# Altium schematic sheet stm32f405.SchDoc
size A4; SheetNumber: 3; SheetTotal: 5
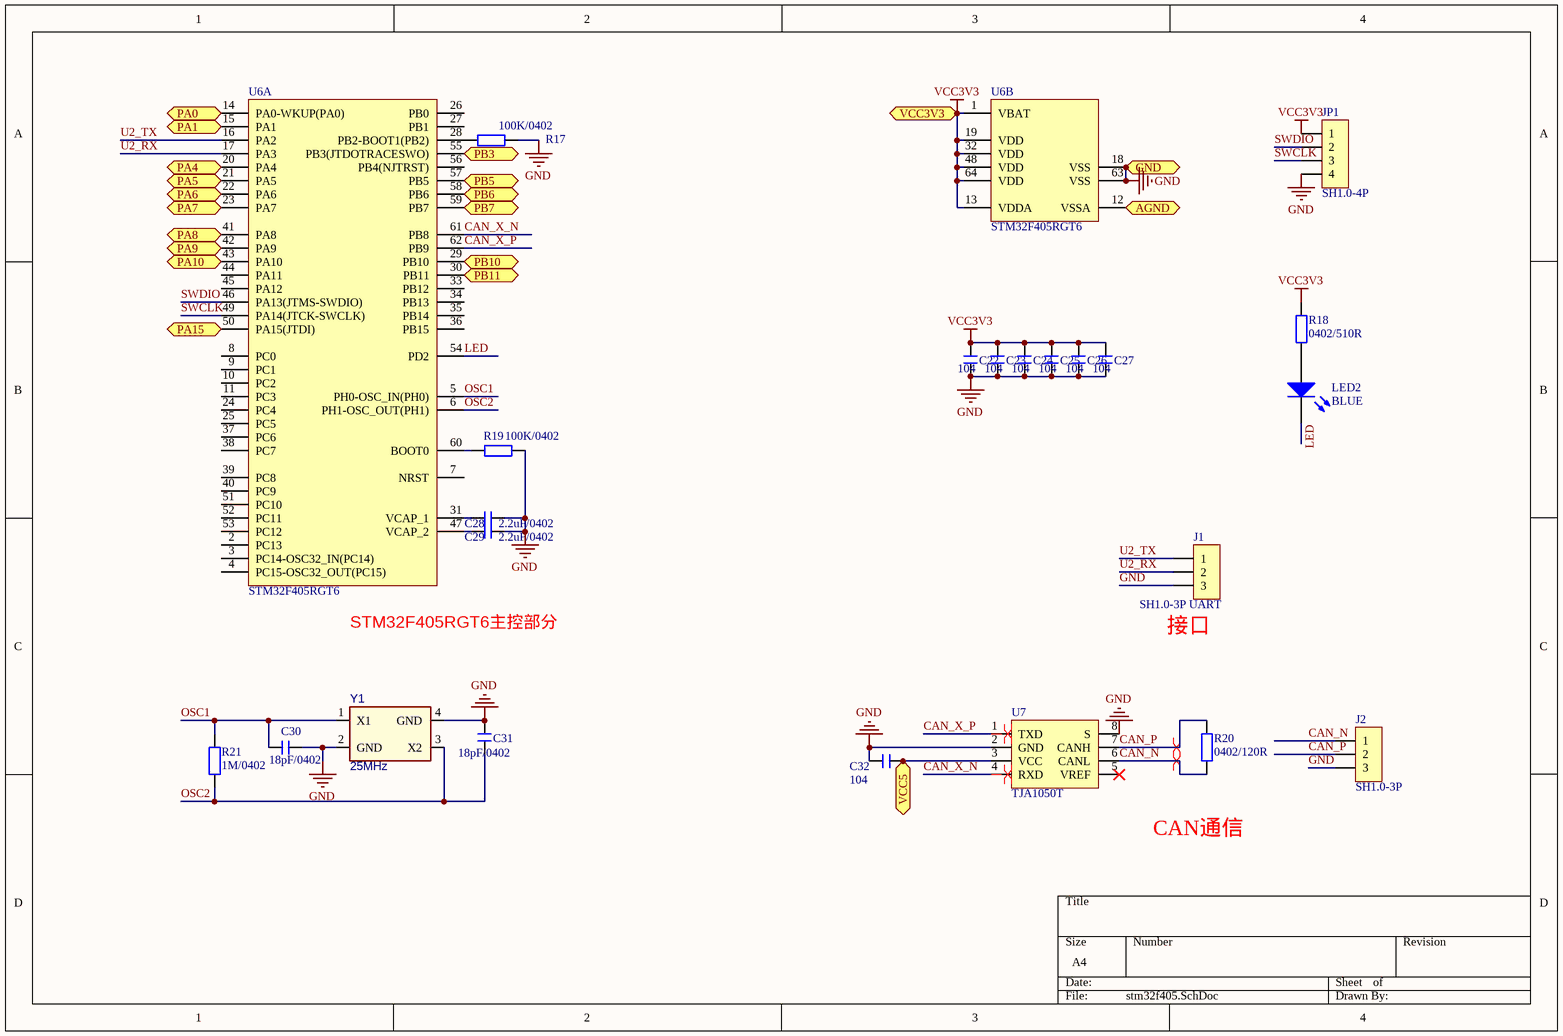
[diagram p0: stm32f405.SchDoc]

## Parts
C22  104  [0402C]
C23  104  [0402C]
C24  104  [0402C]
C25  104  [0402C]
C26  104  [0402C]
C27  104  [0402C]
C28  2.2uF/0402  [0402C]
C29  2.2uF/0402  [0402C]
C30  18pF/0402  [0402C]
C31  18pF/0402  [0402C]
C32  104  [0402C]
J1  SH1.0-3P UART  [SH1.0_3P-P1.00-H3.00]
J2  SH1.0-3P  [SH1.0_3P-P1.00-H3.00]
JP1  SH1.0-4P  [SH1.0-P1.00_-4P]
LED2  BLUE  [LED 0603B]
R17  100K/0402  [0402R]
R18  0402/510R  [0402R]
R19  100K/0402  [0402R]
R20  0402/120R  [0402R]
R21  1M/0402  [0402R]
U6  STM32F405RGT6  [LQFP-64_L10.0-W10.0-P0.50-LS12.0-BL]  (parts A,B of 2)
U7  TJA1050T  [SOP8]
Y1  25MHz  [CRY4_3225]

## Ports
AGND (bidir), GND (bidir), PA0 (bidir), PA1 (bidir), PA4 (bidir), PA5 (bidir), PA6 (bidir), PA7 (bidir), PA8 (bidir), PA9 (bidir), PA10 (bidir), PA15 (bidir), PB3 (bidir), PB5 (bidir), PB6 (bidir), PB7 (bidir), PB10 (bidir), PB11 (bidir), VCC3V3 (bidir), VCC5 (bidir)

## Nets
GND: C22.2 C23.2 C24.2 C25.2 C26.2 C27.2 C28.1 C29.1 C30.1 C31.2 C32.1 J1.3 J2.3 JP1.4 R17.2 R19.2 U6.18(VSS) U6.63(VSS) U7.2(GND) U7.8(S) Y1.2(GND) Y1.4(GND) ; port GND
VCC3V3: C22.1 C23.1 C24.1 C25.1 C26.1 C27.1 JP1.1 R18.1 U6.1(VBAT) U6.13(VDDA) U6.19(VDD) U6.32(VDD) U6.48(VDD) U6.64(VDD) ; port VCC3V3
AGND: U6.12(VSSA) ; port AGND
CAN_N: J2.1 R20.2 U7.6(CANL)
CAN_P: J2.2 R20.1 U7.7(CANH)
CAN_X_N: U6.61(PB8) U7.4(RXD)
CAN_X_P: U6.62(PB9) U7.1(TXD)
LED: LED2.2(K) U6.54(PD2)
OSC1: C30.2 R21.2 U6.5(PH0-OSC_IN(PH0)) Y1.1(X1)
OSC2: C31.1 R21.1 U6.6(PH1-OSC_OUT(PH1)) Y1.3(X2)
PA0: U6.14(PA0-WKUP(PA0)) ; port PA0
PA1: U6.15(PA1) ; port PA1
PA4: U6.20(PA4) ; port PA4
PA5: U6.21(PA5) ; port PA5
PA6: U6.22(PA6) ; port PA6
PA7: U6.23(PA7) ; port PA7
PA8: U6.41(PA8) ; port PA8
PA9: U6.42(PA9) ; port PA9
PA10: U6.43(PA10) ; port PA10
PA15: U6.50(PA15(JTDI)) ; port PA15
PB3: U6.55(PB3(JTDOTRACESWO)) ; port PB3
PB5: U6.57(PB5) ; port PB5
PB6: U6.58(PB6) ; port PB6
PB7: U6.59(PB7) ; port PB7
PB10: U6.29(PB10) ; port PB10
PB11: U6.30(PB11) ; port PB11
SWCLK: JP1.3 U6.49(PA14(JTCK-SWCLK))
SWDIO: JP1.2 U6.46(PA13(JTMS-SWDIO))
U2_RX: J1.2 U6.17(PA3)
U2_TX: J1.1 U6.16(PA2)
VCC5: C32.2 U7.3(VCC) ; port VCC5
NetC28_2: C28.2 U6.31(VCAP_1)
NetC29_2: C29.2 U6.47(VCAP_2)
NetLED2_1: LED2.1(A) R18.2
NetR17_1: R17.1 U6.28(PB2-BOOT1(PB2))
NetR19_1: R19.1 U6.60(BOOT0)

Not connected (* = marked no-connect by the designer): U6 2(PC13) 3(PC14-OSC32_IN(PC14)) 4(PC15-OSC32_OUT(PC15)) 7(NRST) 8(PC0) 9(PC1) 10(PC2) 11(PC3) 24(PC4) 25(PC5) 26(PB0) 27(PB1) 33(PB12) 34(PB13) 35(PB14) 36(PB15) 37(PC6) 38(PC7) 39(PC8) 40(PC9) 44(PA11) 45(PA12) 51(PC10) 52(PC11) 53(PC12) 56(PB4(NJTRST)); U7 5(VREF)*

## Layout directives
differential pair: CAN_N, CAN_P, CAN_X_N, CAN_X_P

## Notes on the sheet
- (near U6) STM32F405RGT6主控部分
- (near J1) 接口
- CAN通信

## Library data of the parts
C22-C32 = C: 贴片电容; BOM名称: 无极性贴片电容
  C22-C27 C32: 嘉立创元件编号: C110251
  C28 C29: 嘉立创元件编号: C12530
  C30 C31: 嘉立创元件编号: C5137554
J1 J2 = 3p_G: 3针排针; 嘉立创元件编号: C7430445
JP1 = 4p_G: 4针排针; BOM名称: 4P接插件; 嘉立创元件编号: C7430446
LED2 = LED: RED 蓝、红; 嘉立创元件编号: C84267
R17 R19 R21 = R: 贴片电阻; BOM名称: 贴片电阻
  R17 R19: 嘉立创元件编号: C25741
  R21: 嘉立创元件编号: C26083
R18 = R: 贴片电阻; value: 510R; 嘉立创元件编号: C25123
R20 = R: 贴片电阻; value: 120R; 嘉立创元件编号: C2909315
U7 = TJA1050T: CAN通信芯片; 嘉立创元件编号: C21714366
Y1 = CRYSTAL_4P: 4脚晶振; 嘉立创元件编号: C70593
U6 = STM32F405RGT6: 嘉立创元件编号: C15742